# Altium schematic sheet Boost_Converter.SchDoc
size C; SheetNumber: 1; SheetTotal: 1
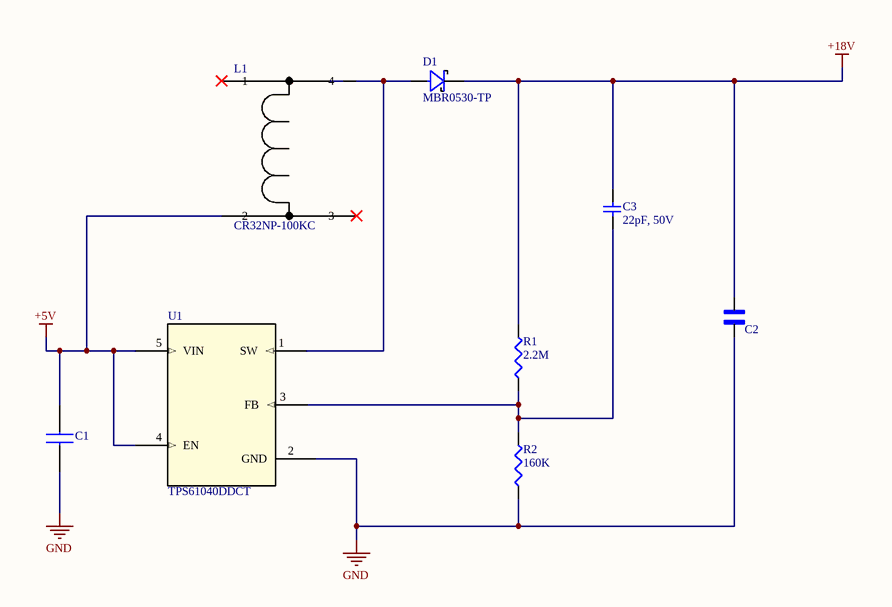
[diagram p0: Boost_Converter.SchDoc]

## Parts
C1  JMK212BJ475MG-T  [CAPC2012X135N]  (value not drawn)
C2  GMK316BJ105KL-T  [CAPC3216X180N]  (value not drawn)
C3  22pF, 50V  [CL05A105KL5NRNC]
D1  MBR0530-TP  [SOD-123_MCC]
L1  CR32NP-100KC  [SMD4_CR32NP_SUM-L]
R1  2.2M  [CL05A105KL5NRNC]
R2  160K  [CL05A105KL5NRNC]
U1  TPS61040DDCT  [DDC5-M]

## Nets
+5V: C1.1 L1.2 U1.4(EN) U1.5(VIN)
+18V: C2.1 C3.2 D1.1 R1.2
GND: C1.2 C2.2 R2.1 U1.2(GND)
NetC3_1: C3.1 R1.1 R2.2 U1.3(FB)
NetD1_2: D1.2 L1.4 U1.1(SW)

Not connected (* = marked no-connect by the designer): L1 1* 3*

## Library data of the parts
C1 = JMK212BJ475MG-T: TAIYO YUDEN - JMK212BJ475MG-T - CERAMIC CAPACITOR 4.7UF, 6.3V, X5R, 20%, 0805; Geometry.Height: 1.35mm; Manufacturer_Name: TAIYO YUDEN; Manufacturer_Part_Number: JMK212BJ475MG-T; Mouser Part Number: 963-JMK212BJ475MG-T; Mouser Price/Stock: https://www.mouser.co.uk/ProductDetail/Taiyo-Yuden/JMK212BJ475MG-T?qs=I6KAKw0tg2zktZTXqiY4IQ%3D%3D; Arrow Part Number: *; Arrow Price/Stock: *; Datasheet Link: http://www.mouser.com/datasheet/2/396/mlcc02_e-1307760.pdf
C2 = GMK316BJ105KL-T: Multilayer Ceramic Capacitor; 1206 35V X7R 1uF +-10% Paper T&R; MF: Taiyo Yuden; SnapEDA_Link: https://www.snapeda.com/parts/GMK316BJ105KL-T/Taiyo+Yuden/view-part/?ref=snap; Package: SMD-2 TAIYO; Value: *; MP: GMK316BJ105KL-T; Check_prices: https://www.snapeda.com/parts/GMK316BJ105KL-T/Taiyo+Yuden/view-part/?ref=eda
C3 = CC0402JRNPO9BN220: CAP CER 22PF 50V C0G/NPO 0402; Manufacturer: Samsung Electro-Mechanics; Manufacturer Part Number: CL05A106MP8NUB8; Value: 10µF; Dielectric Material: Ceramic; Tolerance: 20%; Voltage Rating: 10V; Supplier: Newark; Supplier Part Number: CL05A106MP8NUB8; RoHS: Compliant; Category: Ceramic Capacitors; Stock: 25769; Pricing: 10=0.219, 25=0.191, 50=0.163, 100=0.145, 250=0.131, 500=0.116, 1000=0.107 (USD); Case/Package: 0402; Case Code (Imperial): 0402; Case Code (Metric): 1005; China RoHS: Compliant; Country of Origin: Mainland China, Philippines, South Korea; Export Control Classification Number (ECCN) Code: EAR99; Height: 800µm; Harmonized Tariff Schedule (HTS) Code: 8532.24.00.20; Introduction Date: 2014-02-27; Length: 1mm; Lifecycle Status: Production; Material: Ceramic; Max Operating Temperature: 85°C; Min Operating Temperature: -55°C; Mounting Technology: Surface Mount; Number of Terminals: 2; REACH SVHC: Yes; Schedule B: 8532240020, 8532240020|8532240020, 8532240020|8532240020|8532240020, 8532240020|8532240020|8532240020|8532240020; Thickness: 889µm; Voltage Rating (DC): 10V; Width: 500µm; ComponentLink1URL: https://datasheet.octopart.com:443/CL05A106MP8NUB8-Samsung-Electro-Mechanics-datasheet-136460857.pdf?src-supplier=IHS; ComponentLink1Description: https://datasheet.octopart.com:443/CL05A106MP8NUB8-Samsung-Electro-Mechanics-datasheet-136460857.pdf?src-supplier=IHS; ComponentLink2URL: https://datasheet.octopart.com:443/CL05A106MP8NUB8-Samsung-Electro-Mechanics-datasheet-181551178.pdf?src-supplier=Newark; ComponentLink2Description: https://datasheet.octopart.com:443/CL05A106MP8NUB8-Samsung-Electro-Mechanics-datasheet-181551178.pdf?src-supplier=Newark; ComponentLink3URL: https://datasheet.octopart.com:443/CL05A106MP8NUB8-Samsung-Electro-Mechanics-datasheet-136031724.pdf?src-supplier=Newark; ComponentLink3Description: https://datasheet.octopart.com:443/CL05A106MP8NUB8-Samsung-Electro-Mechanics-datasheet-136031724.pdf?src-supplier=Newark; ComponentLink4URL: https://datasheet.octopart.com:443/CL05A106MP8NUB8-Samsung-Electro-Mechanics-datasheet-141346815.pdf?src-supplier=Samsung+SCT; ComponentLink4Description: https://datasheet.octopart.com:443/CL05A106MP8NUB8-Samsung-Electro-Mechanics-datasheet-141346815.pdf?src-supplier=Samsung+SCT; ComponentLink5URL: https://datasheet.octopart.com:443/CL05A106MP8NUB8-Samsung-Electro-Mechanics-datasheet-110326781.pdf?src-supplier=Future+Electronics; ComponentLink5Description: https://datasheet.octopart.com:443/CL05A106MP8NUB8-Samsung-Electro-Mechanics-datasheet-110326781.pdf?src-supplier=Future+Electronics; ComponentLink6URL: https://datasheet.octopart.com:443/CL05A106MP8NUB8-Samsung-Electro-Mechanics-datasheet-96443587.pdf?src-supplier=Future+Electronics; ComponentLink6Description: https://datasheet.octopart.com:443/CL05A106MP8NUB8-Samsung-Electro-Mechanics-datasheet-96443587.pdf?src-supplier=Future+Electronics; ComponentLink7URL: https://datasheet.octopart.com:443/CL05A106MP8NUB8-Samsung-Electro-Mechanics-datasheet-68297032.pdf?src-supplier=Future+Electronics; ComponentLink7Description: https://datasheet.octopart.com:443/CL05A106MP8NUB8-Samsung-Electro-Mechanics-datasheet-68297032.pdf?src-supplier=Future+Electronics; ComponentLink8URL: https://datasheet.octopart.com:443/CL05A106MP8NUB8-Samsung-Electro-Mechanics-datasheet-86032222.pdf?src-supplier=Future+Electronics; ComponentLink8Description: https://datasheet.octopart.com:443/CL05A106MP8NUB8-Samsung-Electro-Mechanics-datasheet-86032222.pdf?src-supplier=Future+Electronics; LCSC Part NO: C307415
D1 = MBR0530-TP: DIODE SCHOTTKY 30V 500MA SOD123; Manufacturer_Name: MCC; Copyright: Copyright (C) 2025 Ultra Librarian. All rights reserved.; Manufacturer_Part_Number: MBR0530-TP
L1 = CR32NP-100KC: FIXED IND 10UH 760MA 230 MOHM; Manufacturer_Name: Sumida; Type: Fixed Inductors; Copyright: Copyright (C) 2025 Ultra Librarian. All rights reserved.; Manufacturer_Part_Number: CR32NP-100KC; RefDes: RefDes
R1 = RC0402FR-132M2L: RES 2.2M OHM 1% 1/16W 0402; Manufacturer: Yageo Group; Manufacturer Part Number: AC0402FR-075K11L; Max Power Dissipation: 63mW; Power Rating: 62.5mW; Value: 5.11kΩ; Temperature Coefficient: 100ppm/°C; Voltage Rating: 50V; Supplier: Arrow Electronics; Supplier Part Number: AC0402FR-075K11L; RoHS: Compliant; Category: Chip SMD Resistors; Stock: 320000; Pricing: 10000=0.0017, 30000=0.0016 (USD); Case/Package: 0402; China RoHS: Non-Compliant; Composition: Thick Film; Country of Origin: Mainland China, Taiwan; Export Control Classification Number (ECCN) Code: EAR99; Features: Automotive AEC-Q200, Moisture Resistant; Height: 320µm; Harmonized Tariff Schedule (HTS) Code: 8533.21.00.30; Introduction Date: 2012-04-10; Length: 1mm; Lifecycle Status: Production; Max Operating Temperature: 155°C; Min Operating Temperature: -55°C; Mounting Technology: Surface Mount; Number of Terminals: 2; Number of Terminations: 2; Packaging: Tape & Reel; Ratings: AEC-Q200; REACH SVHC: Yes; Schedule B: 8533210045, 8533210045|8533210045|8533210045|8533210045|8533210045; Tolerance: 1%; Width: 500µm; Working Voltage: 50V; ComponentLink1URL: https://datasheet.octopart.com:443/AC0402FR-075K11L-Yageo-datasheet-182189377.pdf?src-supplier=IHS; ComponentLink1Description: https://datasheet.octopart.com:443/AC0402FR-075K11L-Yageo-datasheet-182189377.pdf?src-supplier=IHS; ComponentLink2URL: https://datasheet.octopart.com:443/AC0402FR-075K11L-Yageo-datasheet-83209224.pdf?src-supplier=Upverter; ComponentLink2Description: https://datasheet.octopart.com:443/AC0402FR-075K11L-Yageo-datasheet-83209224.pdf?src-supplier=Upverter; ComponentLink3URL: https://datasheet.octopart.com:443/AC0402FR-075K11L-Yageo-datasheet-178509465.pdf?src-supplier=Farnell; ComponentLink3Description: https://datasheet.octopart.com:443/AC0402FR-075K11L-Yageo-datasheet-178509465.pdf?src-supplier=Farnell; ComponentLink4URL: https://datasheet.octopart.com:443/AC0402FR-075K11L-Yageo-Group-datasheet-193561632.pdf?src-supplier=element14+APAC; ComponentLink4Description: https://datasheet.octopart.com:443/AC0402FR-075K11L-Yageo-Group-datasheet-193561632.pdf?src-supplier=element14+APAC; ComponentLink5URL: https://datasheet.octopart.com:443/AC0402FR-075K11L-Yageo-Group-datasheet-189830439.pdf?src-supplier=Future+Electronics; ComponentLink5Description: https://datasheet.octopart.com:443/AC0402FR-075K11L-Yageo-Group-datasheet-189830439.pdf?src-supplier=Future+Electronics; ComponentLink6URL: https://datasheet.octopart.com:443/AC0402FR-075K11L-Yageo-datasheet-166720450.pdf?src-supplier=Future+Electronics; ComponentLink6Description: https://datasheet.octopart.com:443/AC0402FR-075K11L-Yageo-datasheet-166720450.pdf?src-supplier=Future+Electronics; ComponentLink7URL: https://datasheet.octopart.com:443/AC0402FR-075K11L-Yageo-datasheet-151884373.pdf?src-supplier=Future+Electronics; ComponentLink7Description: https://datasheet.octopart.com:443/AC0402FR-075K11L-Yageo-datasheet-151884373.pdf?src-supplier=Future+Electronics; ComponentLink8URL: https://datasheet.octopart.com:443/AC0402FR-075K11L-Yageo-datasheet-137699919.pdf?src-supplier=Future+Electronics; ComponentLink8Description: https://datasheet.octopart.com:443/AC0402FR-075K11L-Yageo-datasheet-137699919.pdf?src-supplier=Future+Electronics; ComponentLink9URL: https://datasheet.octopart.com:443/AC0402FR-075K11L-Yageo-Group-datasheet-188689268.pdf?src-supplier=LCSC; ComponentLink9Description: https://datasheet.octopart.com:443/AC0402FR-075K11L-Yageo-Group-datasheet-188689268.pdf?src-supplier=LCSC; ComponentLink10URL: https://datasheet.octopart.com:443/AC0402FR-075K11L-Yageo-datasheet-128678413.pdf?src-supplier=X-ON; ComponentLink10Description: https://datasheet.octopart.com:443/AC0402FR-075K11L-Yageo-datasheet-128678413.pdf?src-supplier=X-ON; ComponentLink11URL: https://datasheet.octopart.com/AC0402FR-075K11L-Yageo-datasheet-12512238.pdf; ComponentLink11Description: https://datasheet.octopart.com/AC0402FR-075K11L-Yageo-datasheet-12512238.pdf; ComponentLink12URL: http://sigma.octopart.com:80/conflict_mineral_statement/Yageo-company-3.pdf?src-supplier=Compliance+Statements; ComponentLink12Description: http://sigma.octopart.com:80/conflict_mineral_statement/Yageo-company-3.pdf?src-supplier=Compliance+Statements; ComponentLink13URL: http://sigma.octopart.com:80/rohs_statement/Yageo-company-2.pdf?src-supplier=Compliance+Statements; ComponentLink13Description: http://sigma.octopart.com:80/rohs_statement/Yageo-company-2.pdf?src-supplier=Compliance+Statements; LCSC Part number: C227153
R2 = CPF0402B160KE1: RES SMD 160K OHM 0.1% 1/16W 0402; Manufacturer: Yageo Group; Manufacturer Part Number: AC0402FR-075K11L; Max Power Dissipation: 63mW; Power Rating: 62.5mW; Value: 5.11kΩ; Temperature Coefficient: 100ppm/°C; Tolerance: 1%; Voltage Rating: 50V; Supplier: Arrow Electronics; Supplier Part Number: AC0402FR-075K11L; RoHS: Compliant; Category: Chip SMD Resistors; Stock: 320000; Pricing: 10000=0.0017, 30000=0.0016 (USD); Case/Package: 0402; China RoHS: Non-Compliant; Composition: Thick Film; Country of Origin: Mainland China, Taiwan; Export Control Classification Number (ECCN) Code: EAR99; Features: Automotive AEC-Q200, Moisture Resistant; Height: 320µm; Harmonized Tariff Schedule (HTS) Code: 8533.21.00.30; Introduction Date: 2012-04-10; Length: 1mm; Lifecycle Status: Production; Max Operating Temperature: 155°C; Min Operating Temperature: -55°C; Mounting Technology: Surface Mount; Number of Terminals: 2; Number of Terminations: 2; Packaging: Tape & Reel; Ratings: AEC-Q200; REACH SVHC: Yes; Schedule B: 8533210045, 8533210045|8533210045|8533210045|8533210045|8533210045; Width: 500µm; Working Voltage: 50V; ComponentLink1URL: https://datasheet.octopart.com:443/AC0402FR-075K11L-Yageo-datasheet-182189377.pdf?src-supplier=IHS; ComponentLink1Description: https://datasheet.octopart.com:443/AC0402FR-075K11L-Yageo-datasheet-182189377.pdf?src-supplier=IHS; ComponentLink2URL: https://datasheet.octopart.com:443/AC0402FR-075K11L-Yageo-datasheet-83209224.pdf?src-supplier=Upverter; ComponentLink2Description: https://datasheet.octopart.com:443/AC0402FR-075K11L-Yageo-datasheet-83209224.pdf?src-supplier=Upverter; ComponentLink3URL: https://datasheet.octopart.com:443/AC0402FR-075K11L-Yageo-datasheet-178509465.pdf?src-supplier=Farnell; ComponentLink3Description: https://datasheet.octopart.com:443/AC0402FR-075K11L-Yageo-datasheet-178509465.pdf?src-supplier=Farnell; ComponentLink4URL: https://datasheet.octopart.com:443/AC0402FR-075K11L-Yageo-Group-datasheet-193561632.pdf?src-supplier=element14+APAC; ComponentLink4Description: https://datasheet.octopart.com:443/AC0402FR-075K11L-Yageo-Group-datasheet-193561632.pdf?src-supplier=element14+APAC; ComponentLink5URL: https://datasheet.octopart.com:443/AC0402FR-075K11L-Yageo-Group-datasheet-189830439.pdf?src-supplier=Future+Electronics; ComponentLink5Description: https://datasheet.octopart.com:443/AC0402FR-075K11L-Yageo-Group-datasheet-189830439.pdf?src-supplier=Future+Electronics; ComponentLink6URL: https://datasheet.octopart.com:443/AC0402FR-075K11L-Yageo-datasheet-166720450.pdf?src-supplier=Future+Electronics; ComponentLink6Description: https://datasheet.octopart.com:443/AC0402FR-075K11L-Yageo-datasheet-166720450.pdf?src-supplier=Future+Electronics; ComponentLink7URL: https://datasheet.octopart.com:443/AC0402FR-075K11L-Yageo-datasheet-151884373.pdf?src-supplier=Future+Electronics; ComponentLink7Description: https://datasheet.octopart.com:443/AC0402FR-075K11L-Yageo-datasheet-151884373.pdf?src-supplier=Future+Electronics; ComponentLink8URL: https://datasheet.octopart.com:443/AC0402FR-075K11L-Yageo-datasheet-137699919.pdf?src-supplier=Future+Electronics; ComponentLink8Description: https://datasheet.octopart.com:443/AC0402FR-075K11L-Yageo-datasheet-137699919.pdf?src-supplier=Future+Electronics; ComponentLink9URL: https://datasheet.octopart.com:443/AC0402FR-075K11L-Yageo-Group-datasheet-188689268.pdf?src-supplier=LCSC; ComponentLink9Description: https://datasheet.octopart.com:443/AC0402FR-075K11L-Yageo-Group-datasheet-188689268.pdf?src-supplier=LCSC; ComponentLink10URL: https://datasheet.octopart.com:443/AC0402FR-075K11L-Yageo-datasheet-128678413.pdf?src-supplier=X-ON; ComponentLink10Description: https://datasheet.octopart.com:443/AC0402FR-075K11L-Yageo-datasheet-128678413.pdf?src-supplier=X-ON; ComponentLink11URL: https://datasheet.octopart.com/AC0402FR-075K11L-Yageo-datasheet-12512238.pdf; ComponentLink11Description: https://datasheet.octopart.com/AC0402FR-075K11L-Yageo-datasheet-12512238.pdf; ComponentLink12URL: http://sigma.octopart.com:80/conflict_mineral_statement/Yageo-company-3.pdf?src-supplier=Compliance+Statements; ComponentLink12Description: http://sigma.octopart.com:80/conflict_mineral_statement/Yageo-company-3.pdf?src-supplier=Compliance+Statements; ComponentLink13URL: http://sigma.octopart.com:80/rohs_statement/Yageo-company-2.pdf?src-supplier=Compliance+Statements; ComponentLink13Description: http://sigma.octopart.com:80/rohs_statement/Yageo-company-2.pdf?src-supplier=Compliance+Statements; LCSC Part number: C227153
U1 = TPS61040DDCT: 28-V, 400-mA Switch Boost Converter in SOT-23 for LCD and White LED Applications 5-SOT-23-THIN -40 to 125; Manufacturer_Name: Texas Instruments; Copyright: Copyright (C) 2026 Ultra Librarian. All rights reserved.; Manufacturer_Part_Number: TPS61040DDCT; RefDes: RefDes; Type: Type